# Altium schematic sheet Memory_Section.SchDoc
size A; SheetNumber: 4; SheetTotal: 5
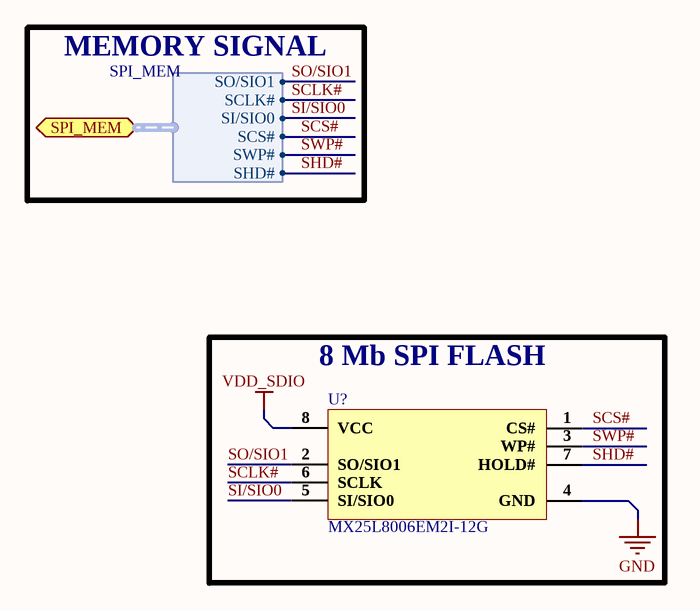
[diagram p0: Memory_Section.SchDoc]

## Parts
U?  MX25L8006EM2I-12G  [SOP- 8]

## Blocks framed on the sheet
8 Mb SPI FLASH: U?

## Ports
SPI_MEM (bidir, harness SPI_MEM)

## Harnesses
SPI_MEM: SO/SIO1, SCLK#, SI/SIO0, SCS#, SWP#, SHD#

## Nets
GND: U?.4(GND)
VDD_SDIO: U?.8(VCC)
SCLK#: U?.6(SCLK) ; port SPI_MEM.SCLK#
SCS#: U?.1(CS#) ; port SPI_MEM.SCS#
SHD#: U?.7(HOLD#) ; port SPI_MEM.SHD#
SI/SIO0: U?.5(SI/SIO0) ; port SPI_MEM.SI/SIO0
SO/SIO1: U?.2(SO/SIO1) ; port SPI_MEM.SO/SIO1
SWP#: U?.3(WP#) ; port SPI_MEM.SWP#

## Notes on the sheet
- MEMORY SIGNAL

## Library data of the parts
U? = MX25L8006EM2I-12G: IC FLASH 8MBIT SPI 86MHZ 8SOP; Manufacturer: Macronix; Operating Supply Voltage: 3.6V; Density: 8Mb; Interface: SPI,Serial; Memory Type: Non-Volatile,FLASH; Supplier 1: Future Electronics; Manufacturer Part Number: MX25L8006EM2I-12G; RoHS: Yes; Category: Flash; Stock 1: 5568; Pricing 1: 1=0.54000, 75=0.47500, 250=0.46000, 750=0.44500, 2500=0.43000 (USD); Mount: Surface Mount; Case/Package: SOIC; Min Operating Temperature: -40°C; Max Operating Temperature: 85°C; Max Frequency: 86MHz; Packaging: Rail/Tube; Package Quantity: 98; Frequency: 86MHz; Memory Size: 8Mb; Series: MX25xxx05/06; Supply Voltage-Nom: 3.6V; Lead Free: Lead Free; Temperature Grade: INDUSTRIAL; RoHS Compliant: Yes; ComponentLink1URL: http://ckassoc.com/oldsite/pdf/Macronix_Product_Line_Card_July_2017_General%20_070617.pdf?src-supplier=Digi-Key; ComponentLink1Description: http://ckassoc.com/oldsite/pdf/Macronix_Product_Line_Card_July_2017_General%20_070617.pdf?src-supplier=Digi-Key; ComponentLink2URL: http://www.macronix.com/Lists/DataSheet/Attachments/1610/MX25L8006E,%203V,%208Mb,%20v1.4.pdf?src-supplier=Future+Electronics; ComponentLink2Description: http://www.macronix.com/Lists/DataSheet/Attachments/1610/MX25L8006E,%203V,%208Mb,%20v1.4.pdf?src-supplier=Future+Electronics; Supplier Part Number 1: 1123114